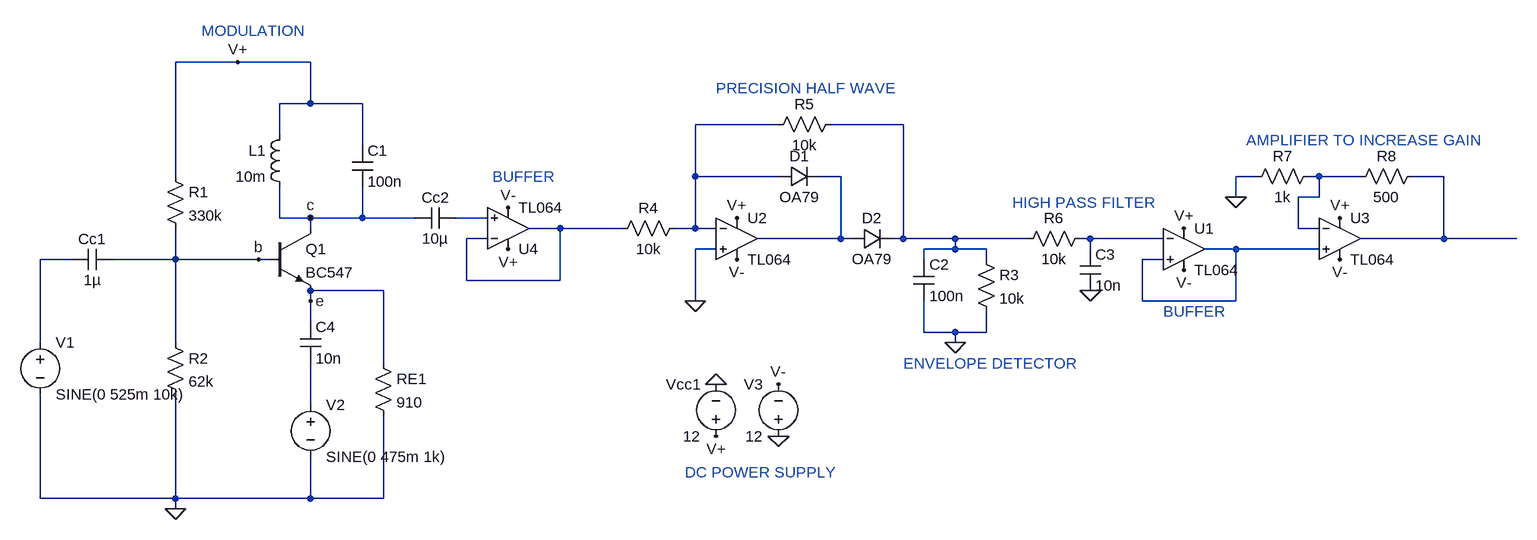
[diagram p0: schematic Draft1.asc]
Draft1.asc, the LTspice schematic file:
Version 4
SHEET 1 1172 680
WIRE -800 -272 -896 -272
WIRE -688 -272 -800 -272
WIRE -688 -208 -688 -272
WIRE -688 -208 -736 -208
WIRE -608 -208 -688 -208
WIRE 32 -176 -96 -176
WIRE 224 -176 112 -176
WIRE -736 -160 -736 -208
WIRE -608 -144 -608 -208
WIRE -896 -96 -896 -272
WIRE -96 -96 -96 -176
WIRE 32 -96 -96 -96
WIRE 128 -96 96 -96
WIRE 768 -96 736 -96
WIRE 864 -96 848 -96
WIRE 928 -96 864 -96
WIRE 1056 -96 1008 -96
WIRE 736 -64 736 -96
WIRE 864 -64 864 -96
WIRE 864 -64 832 -64
WIRE -736 -32 -736 -80
WIRE -688 -32 -736 -32
WIRE -608 -32 -608 -80
WIRE -608 -32 -688 -32
WIRE -528 -32 -608 -32
WIRE -416 -32 -464 -32
WIRE -688 -16 -688 -32
WIRE -304 -16 -352 -16
WIRE -208 -16 -304 -16
WIRE -96 -16 -96 -96
WIRE -96 -16 -128 -16
WIRE -64 -16 -96 -16
WIRE 832 -16 832 -64
WIRE 864 -16 832 -16
WIRE -416 0 -448 0
WIRE 128 0 128 -96
WIRE 128 0 0 0
WIRE 144 0 128 0
WIRE 224 0 224 -176
WIRE 224 0 208 0
WIRE 304 0 224 0
WIRE 416 0 304 0
WIRE 512 0 496 0
WIRE 624 0 512 0
WIRE 1056 0 1056 -96
WIRE 1056 0 928 0
WIRE 1168 0 1056 0
WIRE -64 16 -96 16
WIRE 304 16 304 0
WIRE 304 16 256 16
WIRE 352 16 304 16
WIRE 512 16 512 0
WIRE 736 16 688 16
WIRE 864 16 736 16
WIRE -1056 32 -1104 32
WIRE -896 32 -896 -16
WIRE -896 32 -992 32
WIRE -768 32 -896 32
WIRE -752 32 -768 32
WIRE 256 32 256 16
WIRE 352 32 352 16
WIRE 624 32 592 32
WIRE -448 64 -448 0
WIRE -304 64 -304 -16
WIRE -304 64 -448 64
WIRE -576 80 -688 80
WIRE -688 96 -688 80
WIRE -96 96 -96 16
WIRE 592 96 592 32
WIRE 736 96 736 16
WIRE 736 96 592 96
WIRE -688 128 -688 96
WIRE 256 144 256 96
WIRE 304 144 256 144
WIRE 352 144 352 112
WIRE 352 144 304 144
WIRE -1104 160 -1104 32
WIRE -896 160 -896 32
WIRE 304 160 304 144
WIRE -576 192 -576 80
WIRE -688 256 -688 192
WIRE -1104 400 -1104 240
WIRE -896 400 -896 240
WIRE -896 400 -1104 400
WIRE -688 400 -688 336
WIRE -688 400 -896 400
WIRE -576 400 -576 272
WIRE -576 400 -688 400
WIRE -896 416 -896 400
FLAG -64 224 0
FLAG -896 416 0
FLAG -688 -32 c
FLAG -768 32 b
FLAG -688 96 e
FLAG 304 160 0
FLAG -96 96 0
FLAG 32 304 0
FLAG 512 80 0
FLAG 736 -64 0
FLAG -64 304 V+
FLAG -384 16 V+
FLAG -32 -32 V+
FLAG 656 -16 V+
FLAG 896 -32 V+
FLAG -800 -272 V+
FLAG 32 224 V-
FLAG -384 -48 V-
FLAG -32 32 V-
FLAG 656 48 V-
FLAG 896 32 V-
SYMBOL ind -720 -176 M0
SYMATTR InstName L1
SYMATTR Value 10m
SYMBOL npn -752 -16 R0
SYMATTR InstName Q1
SYMATTR Value BC547
SYMBOL voltage -64 320 R180
WINDOW 0 24 96 Left 2
WINDOW 3 24 16 Left 2
WINDOW 123 0 0 Left 0
WINDOW 39 0 0 Left 0
SYMATTR InstName Vcc1
SYMATTR Value 12
SYMBOL res -912 -112 R0
SYMATTR InstName R1
SYMATTR Value 330k
SYMBOL res -912 144 R0
SYMATTR InstName R2
SYMATTR Value 62k
SYMBOL res -592 176 R0
SYMATTR InstName RE1
SYMATTR Value 910
SYMBOL cap -624 -144 R0
SYMATTR InstName C1
SYMATTR Value 100n
SYMBOL voltage -1104 144 R0
WINDOW 123 0 0 Left 0
WINDOW 39 0 0 Left 0
SYMATTR InstName V1
SYMATTR Value SINE(0 525m 10k)
SYMBOL voltage -688 240 R0
WINDOW 123 0 0 Left 0
WINDOW 39 0 0 Left 0
SYMATTR InstName V2
SYMATTR Value SINE(0 475m 1k)
SYMBOL cap -992 16 R90
WINDOW 0 0 32 VBottom 2
WINDOW 3 32 32 VTop 2
SYMATTR InstName Cc1
SYMATTR Value 1µ
SYMBOL cap -464 -48 R90
WINDOW 0 0 32 VBottom 2
WINDOW 3 32 32 VTop 2
SYMATTR InstName Cc2
SYMATTR Value 10µ
SYMBOL res 336 16 R0
SYMATTR InstName R3
SYMATTR Value 10k
SYMBOL cap 240 32 R0
SYMATTR InstName C2
SYMATTR Value 100n
SYMBOL res -112 -32 R90
WINDOW 0 0 56 VBottom 2
WINDOW 3 32 56 VTop 2
SYMATTR InstName R4
SYMATTR Value 10k
SYMBOL res 128 -192 R90
WINDOW 0 0 56 VBottom 2
WINDOW 3 32 56 VTop 2
SYMATTR InstName R5
SYMATTR Value 10k
SYMBOL diode 32 -80 R270
WINDOW 0 32 32 VTop 2
WINDOW 3 0 32 VBottom 2
SYMATTR InstName D1
SYMATTR Value OA79
SYMBOL diode 144 16 R270
WINDOW 0 32 32 VTop 2
WINDOW 3 0 32 VBottom 2
SYMATTR InstName D2
SYMATTR Value OA79
SYMBOL voltage 32 320 R180
WINDOW 0 24 96 Left 2
WINDOW 3 24 16 Left 2
SYMATTR InstName V3
SYMATTR Value 12
SYMBOL res 400 16 R270
WINDOW 0 32 56 VTop 2
WINDOW 3 0 56 VBottom 2
SYMATTR InstName R6
SYMATTR Value 10k
SYMBOL cap 496 16 R0
SYMATTR InstName C3
SYMATTR Value 10n
SYMBOL OpAmps\\opamp2 656 -48 R0
SYMATTR InstName U1
SYMATTR Value TL064
SYMBOL OpAmps\\opamp2 -32 -64 R0
SYMATTR InstName U2
SYMATTR Value TL064
SYMBOL OpAmps\\opamp2 896 -64 R0
SYMATTR InstName U3
SYMATTR Value TL064
SYMBOL res 864 -112 R90
WINDOW 0 0 56 VBottom 2
WINDOW 3 32 56 VTop 2
SYMATTR InstName R7
SYMATTR Value 1k
SYMBOL res 1024 -112 R90
WINDOW 0 0 56 VBottom 2
WINDOW 3 32 56 VTop 2
SYMATTR InstName R8
SYMATTR Value 500
SYMBOL OpAmps\\opamp2 -384 48 M180
SYMATTR InstName U4
SYMATTR Value TL064
SYMBOL cap -704 128 R0
SYMATTR InstName C4
SYMATTR Value 10n
TEXT -112 360 Left 2 ;DC POWER SUPPLY
TEXT -856 -320 Left 2 ;MODULATION
TEXT -408 -96 Left 2 ;BUFFER
TEXT -64 -232 Left 2 ;PRECISION HALF WAVE
TEXT 224 192 Left 2 ;ENVELOPE DETECTOR
TEXT 392 -56 Left 2 ;HIGH PASS FILTER
TEXT 624 112 Left 2 ;BUFFER
TEXT 752 -152 Left 2 ;AMPLIFIER TO INCREASE GAIN

The netlist it stands for:
* Draft1.asc
L1 V+ c 10m
Q1 c b e 0 BC547
Vcc1 V+ 0 12
R1 V+ b 330k
R2 b 0 62k
RE1 e 0 910
C1 V+ c 100n
V1 N010 0 SINE(0 525m 10k)
V2 N011 0 SINE(0 475m 1k)
Cc1 b N010 1µ
Cc2 N006 c 10µ
R3 N002 0 10k
C2 N002 0 100n
R4 N001 N007 10k
R5 N002 N001 10k
D1 N001 N003 OA79
D2 N003 N002 OA79
V3 0 V- 12
R6 N002 N008 10k
C3 N008 0 10n
XU1 N009 N008 V+ V- N009 TL064  ; pins In+ In- V+ V- OUT
XU2 0 N001 V+ V- N003 TL064  ; pins In+ In- V+ V- OUT
XU3 N009 N004 V+ V- N005 TL064  ; pins In+ In- V+ V- OUT
R7 N004 0 1k
R8 N005 N004 500
XU4 N006 N007 V+ V- N007 TL064  ; pins In+ In- V+ V- OUT
C4 e N011 10n
.model D D
.lib standard.dio
.model NPN NPN
.model PNP PNP
.lib standard.bjt
* DC POWER SUPPLY
* MODULATION
* BUFFER
* PRECISION HALF WAVE
* ENVELOPE DETECTOR
* HIGH PASS FILTER
* BUFFER
* AMPLIFIER TO INCREASE GAIN
.backanno
.end